# Altium project Pukk-Sensor-Module-v1.0.PrjPcb (part 2 of 6)

## Sheet Power-Sheet.SchDoc
size 420 x 297 mm; SheetNumber: 2; SheetTotal: 8
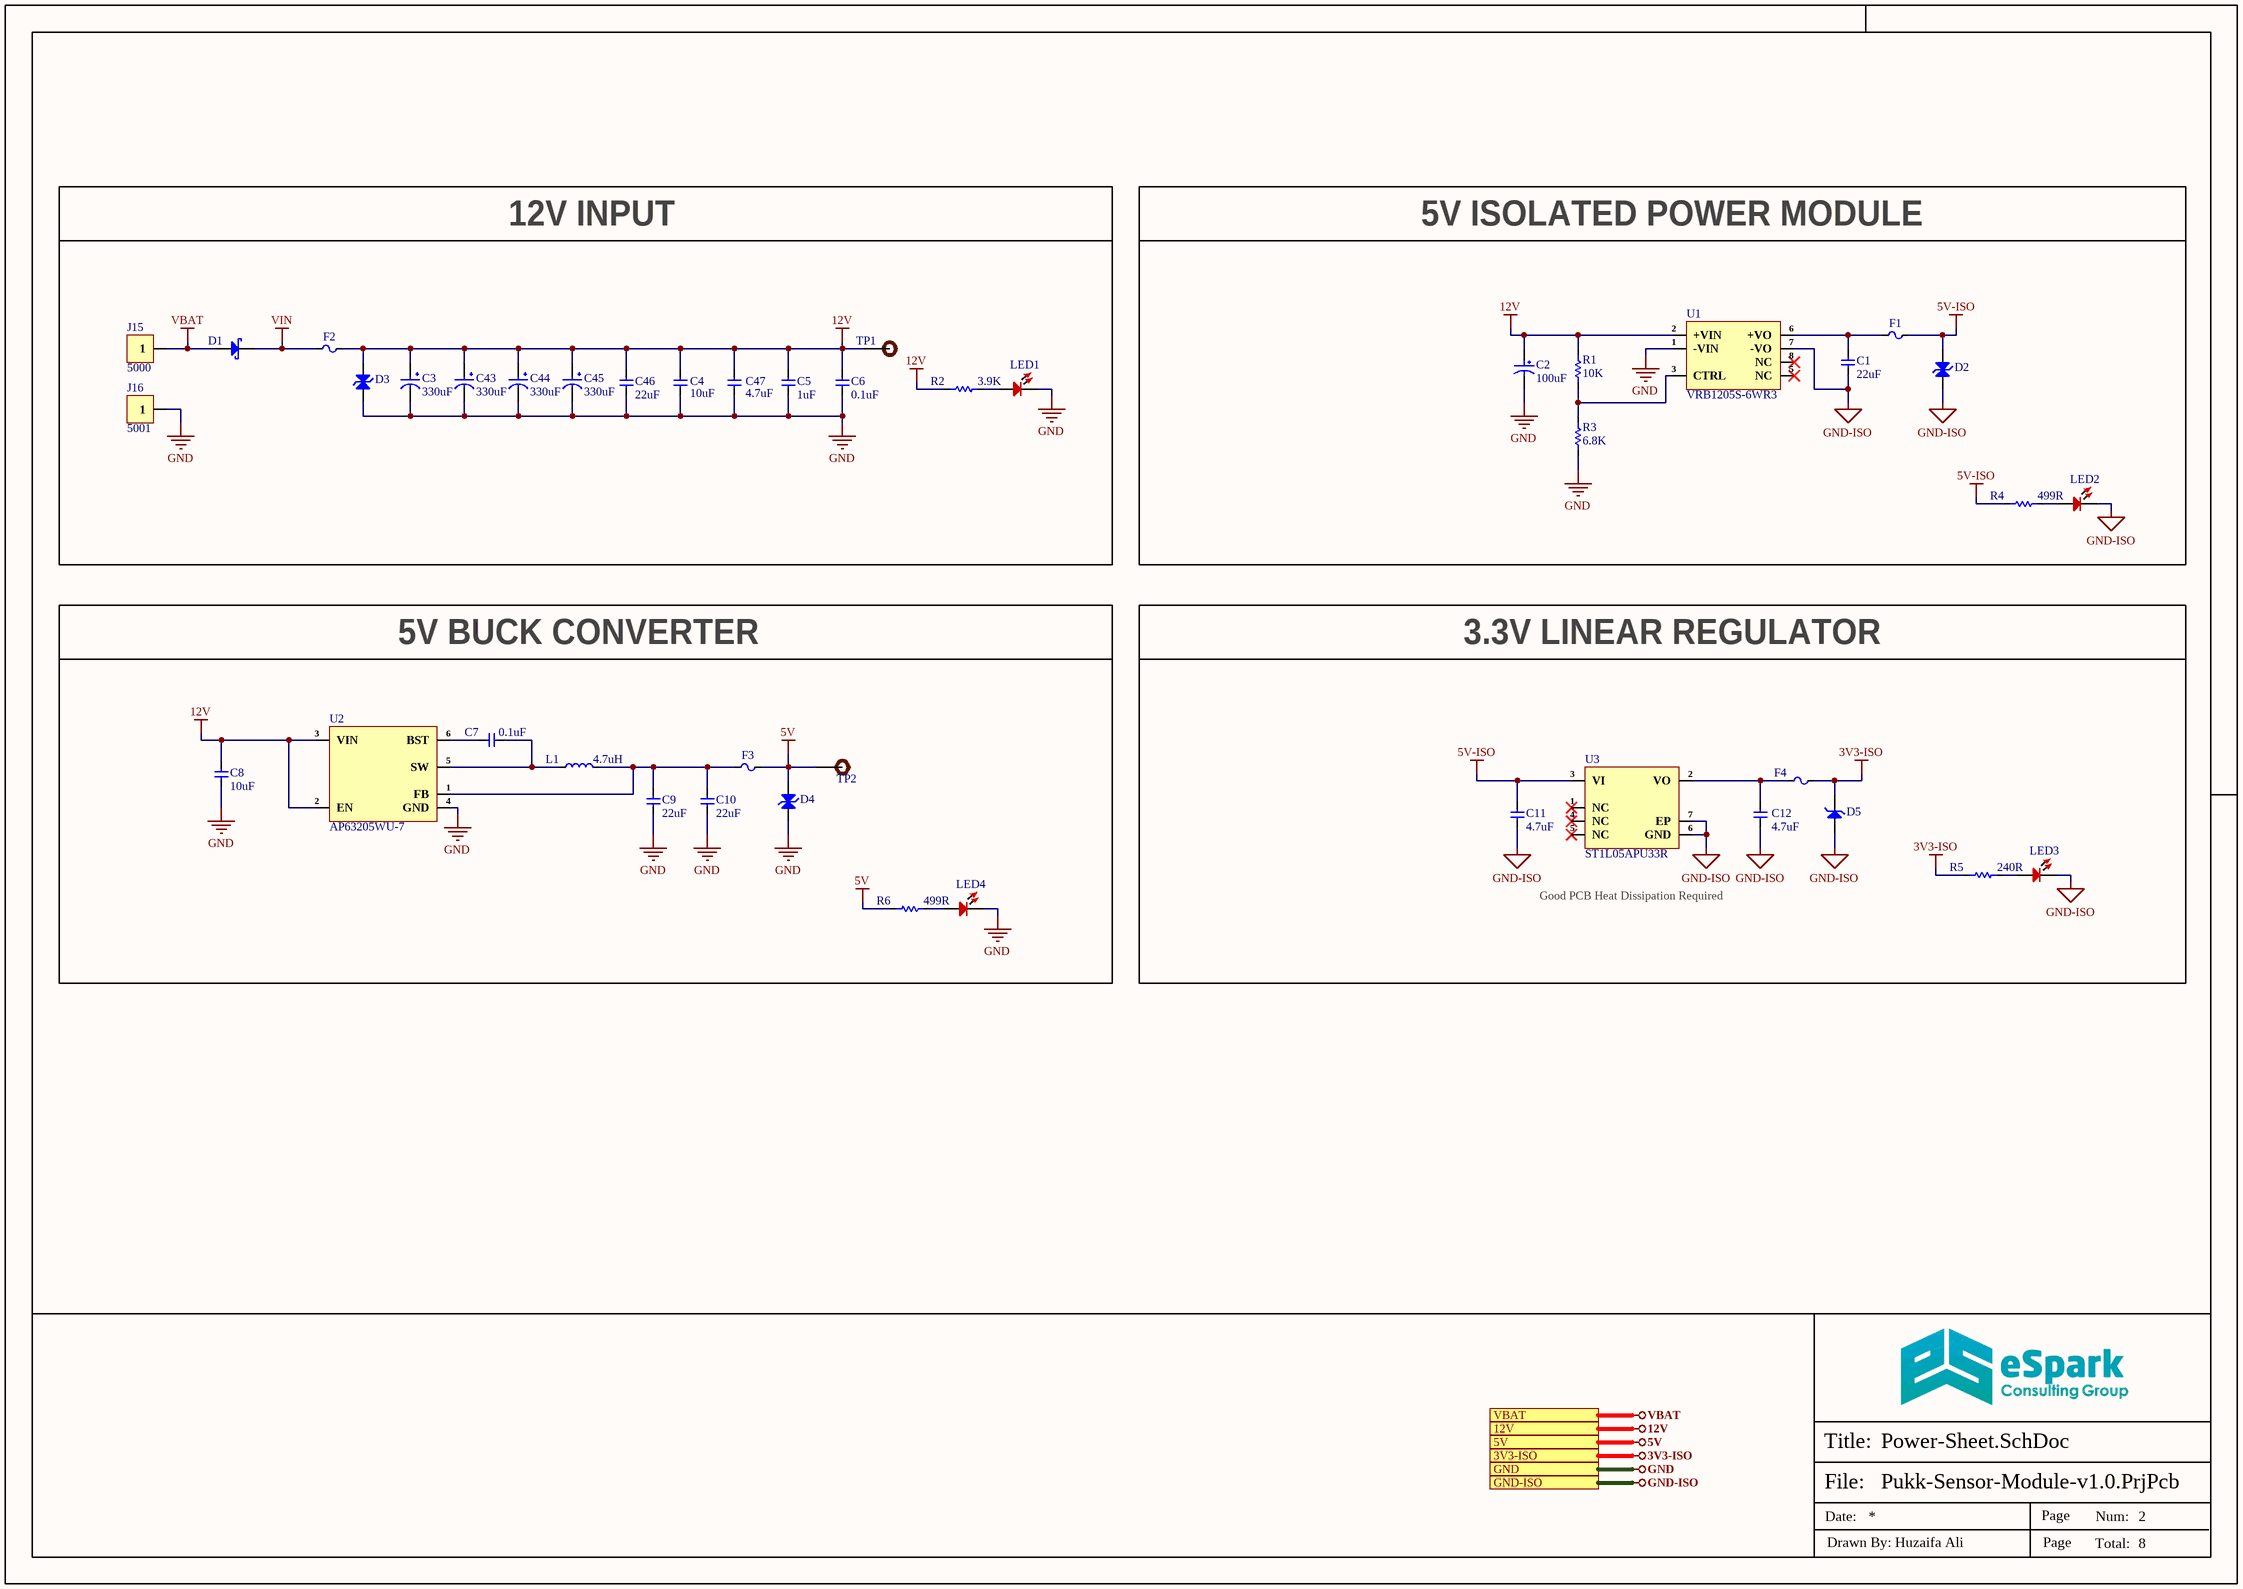
[diagram p1: Power-Sheet.SchDoc]

### Parts
C1  22uF  [Cap-0805]
C2  100uF  [EEE-FK1E101XP]
C3  330uF  [UWT1E331MNL1GS]
C4  10uF  [Cap-0805]
C5  1uF  [Cap-0805]
C6  0.1uF  [Cap-0805]
C7  0.1uF  [Cap-0603]
C8  10uF  [Cap-1210]
C9  22uF  [Cap-0805]
C10  22uF  [Cap-0805]
C11  4.7uF  [Cap-1206]
C12  4.7uF  [Cap-0603]
C43  330uF  [UWT1E331MNL1GS]
C44  330uF  [UWT1E331MNL1GS]
C45  330uF  [UWT1E331MNL1GS]
C46  22uF  [Cap-0805]
C47  4.7uF  [Cap-0805]
D1  SS26  [SMA(DO-214AC)]  (value not drawn)
D2  SMAJ5.0CA  [SMA Bi Directional]  (value not drawn)
D3  SD15C.TCT  [SOD-323 (Bi-directional)]  (value not drawn)
D4  SMAJ5.0CA  [SMA Bi Directional]  (value not drawn)
D5  MSP3V3HM3/89A  [MicroSMP]  (value not drawn)
F1  0805L110SLYR  [Fuse-0805]  (value not drawn)
F2  1210L075/24PR  [FUSE-1210]  (value not drawn)
F3  0805L050WR  [Fuse-0805]  (value not drawn)
F4  0805L110SLYR  [Fuse-0805]  (value not drawn)
J15  5000  [5000]
J16  5001  [5001]
L1  4.7uH  [SRN4018-4R7M]
LED1  RED  [LED-0603]  (value not drawn)
LED2  RED  [LED-0603]  (value not drawn)
LED3  RED  [LED-0603]  (value not drawn)
LED4  RED  [LED-0603]  (value not drawn)
R1  10K  [Res-0402]
R2  3.9K  [Res-0402]
R3  6.8K  [Res-0402]
R4  499R  [Res-0402]
R5  240R  [Res-0402]
R6  499R  [Res-0402]
TP1  TEST POINT  [Test-point]  (value not drawn)  (no BOM)
TP2  TEST POINT  [Test-point]  (value not drawn)  (no BOM)
U1  VRB1205S-6WR3  [VRB1205S-6WR3]
U2  AP63205WU-7  [TSOT-23-6]
U3  ST1L05APU33R  [DFN-6(3x3)]

### Blocks framed on the sheet
12V INPUT: C3-C6 C43-C47 D1 D3 F2 J15 J16 LED1 R2 TP1
5V ISOLATED POWER MODULE: C1 C2 D2 F1 LED2 R1 R3 R4 U1
5V BUCK CONVERTER: C7-C10 D4 F3 L1 LED4 R6 TP2 U2
3.3V LINEAR REGULATOR: C11 C12 D5 F4 LED3 R5 U3

### Ports
3V3-ISO (see Top-Sheet[2A], CAN-Sheet[4D], Controller-Sheet-1[4D], Controller-Sheet-2[4D], Sensors-Sheet[1D]), 5V (see Top-Sheet[2A], Sensors-Sheet[1D]), 12V (see Top-Sheet[2A], Sensors-Sheet[1D]), GND (see Top-Sheet[2A], Connector-Sheet[4D], Sensors-Sheet[1D]), GND-ISO (see Top-Sheet[2A], CAN-Sheet[4D], Controller-Sheet-1[4D], Controller-Sheet-2[4D], Sensors-Sheet[1D], USB-Sheet[4D]), VBAT (see Top-Sheet[2A], Connector-Sheet[4D])

### Nets
3V3-ISO: D5.2(K) F4.2 R5.1 ; port 3V3-ISO
5V: D4.2(K) F3.2 R6.1 TP2.1 ; port 5V
5V-ISO: C11.2 D2.2(K) F1.2 R4.1 U3.3(VI)
12V: C2.1 C3.1 C4.2 C5.2 C6.2 C8.2 C43.1 C44.1 C45.1 C46.2 C47.2 D3.2(A) F2.2 R1.2 R2.1 TP1.1 U1.2(+VIN) U2.2(EN) U2.3(VIN) ; port 12V
GND: C2.2 C3.2 C4.1 C5.1 C6.1 C8.1 C9.1 C10.1 C43.2 C44.2 C45.2 C46.1 C47.1 D3.1(A) D4.1(A) J16.1 LED1.2 LED4.2 R3.1 U1.1(-VIN) U2.4(GND) ; port GND
GND-ISO: C1.1 C11.1 C12.1 D2.1(A) D5.1(A) LED2.2 LED3.2 U1.7(-VO) U3.6(GND) U3.7(EP) ; port GND-ISO
VBAT: D1.2(A) J15.1 ; port VBAT
VIN: D1.1(K) F2.1
NetC1_2: C1.2 F1.1 U1.6(+VO)
NetC7_1: C7.1 L1.1 U2.5(SW)
NetC7_2: C7.2 U2.6(BST)
NetC9_2: C9.2 C10.2 F3.1 L1.2 U2.1(FB)
NetC12_2: C12.2 F4.1 U3.2(VO)
NetLED1_1: LED1.1 R2.2
NetLED2_1: LED2.1 R4.2
NetLED3_1: LED3.1 R5.2
NetLED4_1: LED4.1 R6.2
NetR1_1: R1.1 R3.2 U1.3(CTRL)

Not connected (* = marked no-connect by the designer): U1 5(NC)* 8(NC)*; U3 1(NC)* 4(NC)* 5(NC)*

### Notes on the sheet
- Good PCB Heat Dissipation Required
- File:
- Title:
- Date:
- Page
- Num:
- Total:
- Drawn By: Huzaifa Ali

### Library data of the parts
C1 C9 C10 = GRM21BZ71A226ME15L: CAP CER 22UF 10V X7R 0805; Manufacturer: Murata; Material: 4241ConductorMaterial; Tolerance: 20%; Item Type: Capacitor; Supplier: Digi-Key; Supplier Part Number: 490-GRM21BZ71A226ME15LCT-ND; Manufacturer Part Number: GRM21BZ71A226ME15L; RoHS: Yes; Category: Ceramic Capacitors; Stock: 49126; Pricing: 1=0.39, 10=0.259, 50=0.191, 100=0.1556, 500=0.12282, 1000=0.10372 (USD); Package: 0805; Min Operating Temperature: -55°C; Max Operating Temperature: 125°C; Value: 22uF; Voltage Rating: 10V; Length: 2mm; Width: 1.25mm; Height: 1.45mm; Thickness: 1.25mm; ComponentLink1URL: https://datasheet.octopart.com/GRM21BZ71A226ME15L-Murata-datasheet-165579666.pdf?src-supplier=TME; ComponentLink1Description: https://datasheet.octopart.com/GRM21BZ71A226ME15L-Murata-datasheet-165579666.pdf?src-supplier=TME; LCSC Part Number: C907991; ComponentLink2Description: LCSC; ComponentLink2URL: https://www.lcsc.com/product-detail/Multilayer-Ceramic-Capacitors-MLCC-SMD-SMT_Murata-Electronics-GRM21BZ71A226ME15L_C907991.html
C2 = EEE-FK1E101XP: CAP ALUM 100UF 20% 25V SMD; Manufacturer: Panasonic; Item Type: Capacitor; Ripple Current: 280mA; ESR (Equivalent Series Resistance): 340mR; Life (Hours): 2000Hour; Leakage Current: 3uA; Lead Diameter: 0.65mm; Supplier: Mouser; LCSC Part Number: C128510; Manufacturer Part Number: EEE-FK1E101XP; RoHS: Yes; Stock: 18001; Pricing: 1=0.56, 10=0.293, 50=0.293, 100=0.263, 1000=0.168, 10000=0.147 (USD); Mounting Technology: Surface Mount,PCB; Case/Package: Radial; Pins: 8; Min Operating Temperature: -55°C; Max Operating Temperature: 105°C; Tolerance: 20%; Value: 100uF; Voltage Rating (DC): 25V; Packaging: Tape and Reel; Voltage Rating: 25V; Ripple Current (AC): 280mA; Impedance: 340mR; Package Quantity: 1; Termination: SMD/SMT; Voltage: 25V; Series: FK; Construction: Cylindrical; Diameter: 6.3mm; Length: 7.7mm; Width: 7.8mm; Height: 7.7mm; Lead Pitch: 1.8mm; Height - Seated (Max): 0.303inch; Ratings: AEC-Q200; Radiation Hardening: No; Reach SVHC Compliant: No; RoHS Compliant: Yes; Lead Free: 5697LeadFree; ComponentLink1URL: https://datasheet.ciiva.com/11777/0900766b80e4e8b0-11777232.pdf?src-supplier=Rs; ComponentLink1Description: https://datasheet.ciiva.com/11777/0900766b80e4e8b0-11777232.pdf?src-supplier=Rs; ComponentLink2URL: https://datasheet.ciiva.com/2983/aba0000ce120-2983949.pdf?src-supplier=Avnet; ComponentLink2Description: https://datasheet.ciiva.com/2983/aba0000ce120-2983949.pdf?src-supplier=Avnet; ComponentLink3URL: https://datasheet.ciiva.com/46386/1676921-46386184.pdf?src-supplier=Element14; ComponentLink3Description: https://datasheet.ciiva.com/46386/1676921-46386184.pdf?src-supplier=Element14; ComponentLink4URL: https://datasheet.ciiva.com/46376/1676921-46376486.pdf?src-supplier=Element14; ComponentLink4Description: https://datasheet.ciiva.com/46376/1676921-46376486.pdf?src-supplier=Element14; ComponentLink5URL: https://datasheet.ciiva.com/43463/58258-43463513.pdf?src-supplier=Farnell; ComponentLink5Description: https://datasheet.ciiva.com/43463/58258-43463513.pdf?src-supplier=Farnell; ComponentLink6URL: https://datasheet.ciiva.com/46386/58258-46386183.pdf?src-supplier=Element14; ComponentLink6Description: https://datasheet.ciiva.com/46386/58258-46386183.pdf?src-supplier=Element14; ComponentLink7URL: https://datasheet.ciiva.com/28678/731857-28678871.pdf?src-supplier=Element14; ComponentLink7Description: https://datasheet.ciiva.com/28678/731857-28678871.pdf?src-supplier=Element14; ComponentLink8URL: https://datasheet.ciiva.com/24023/aba0000ce120-24023434.pdf?src-supplier=Mouser; ComponentLink8Description: https://datasheet.ciiva.com/24023/aba0000ce120-24023434.pdf?src-supplier=Mouser; ComponentLink9URL: https://datasheet.ciiva.com/14594/70258115-14594399.pdf?src-supplier=Allied+Electronics; ComponentLink9Description: https://datasheet.ciiva.com/14594/70258115-14594399.pdf?src-supplier=Allied+Electronics; ComponentLink10URL: https://datasheet.ciiva.com/2983/aba0000ce120-2983950.pdf?src-supplier=Avnet; ComponentLink10Description: https://datasheet.ciiva.com/2983/aba0000ce120-2983950.pdf?src-supplier=Avnet; ComponentLink11URL: https://datasheet.ciiva.com/16449/aba0000ce120-16449109.pdf?src-supplier=Future+Electronics; ComponentLink11Description: https://datasheet.ciiva.com/16449/aba0000ce120-16449109.pdf?src-supplier=Future+Electronics
C3 C43-C45 = UWT1E331MNL1GS: CAP ALUM 330UF 20% 25V SMD; Manufacturer: Nichicon; Polarity: 5066Direction; Item Type: Capacitor; Dielectric Material: 158ConductorMaterial; Manufacturer Part Number: UWT1E331MNL1GS; RoHS: Yes; Lead Free: 5697LeadFree; ComponentLink1URL: https://datasheet.ciiva.com/30522/getdatasheetpartid-457641-30522227.pdf?src-supplier=Verical; ComponentLink1Description: https://datasheet.ciiva.com/30522/getdatasheetpartid-457641-30522227.pdf?src-supplier=Verical; ComponentLink2URL: https://datasheet.ciiva.com/97/e-wt-97107.pdf?src-supplier=Digikey; ComponentLink2Description: https://datasheet.ciiva.com/97/e-wt-97107.pdf?src-supplier=Digikey; ComponentLink3URL: https://datasheet.ciiva.com/97/e-wt-97108.pdf?src-supplier=Digikey; ComponentLink3Description: https://datasheet.ciiva.com/97/e-wt-97108.pdf?src-supplier=Digikey; ComponentLink4URL: https://datasheet.ciiva.com/97/e-wt-97109.pdf?src-supplier=Digikey; ComponentLink4Description: https://datasheet.ciiva.com/97/e-wt-97109.pdf?src-supplier=Digikey; LCSC Part Number: C445067; Supplier: Digikey; Stock: 31265; Pricing: 1=0.53, 10=0.353, 50=0.2762, 100=0.2506 (USD); Pins: 2NUMBER; ComponentLink5URL: https://datasheet.ciiva.com/11782/0900766b80649b51-11782007.pdf?src-supplier=Rs; ComponentLink5Description: https://datasheet.ciiva.com/11782/0900766b80649b51-11782007.pdf?src-supplier=Rs; ComponentLink6URL: https://datasheet.ciiva.com/11686/e-wt-11686502.pdf?src-supplier=Avnet; ComponentLink6Description: https://datasheet.ciiva.com/11686/e-wt-11686502.pdf?src-supplier=Avnet; ComponentLink7URL: https://datasheet.ciiva.com/7851/e-wt-7851757.pdf?src-supplier=Element14; ComponentLink7Description: https://datasheet.ciiva.com/7851/e-wt-7851757.pdf?src-supplier=Element14; ComponentLink8URL: https://datasheet.ciiva.com/16502/e-wt-16502936.pdf?src-supplier=Future+Electronics; ComponentLink8Description: https://datasheet.ciiva.com/16502/e-wt-16502936.pdf?src-supplier=Future+Electronics
C4 = CC0805KKX5R8BB106: CAP CER 10UF 25V X5R 0805; Manufacturer: Yageo; Item Type: Capacitor; Tolerance: 10%; LCSC Part Number: C89831; Manufacturer Part Number: CC0805KKX5R8BB106; RoHS: Yes; Case/Package: 0805; Case Code (Metric): 2012; Case Code (Imperial): 0805; Weight: 0.000194oz; Min Operating Temperature: -55°C; Max Operating Temperature: 85°C; Voltage Rating: 25V; Packaging: Tape and Reel; Dielectric: X5R; Termination: SMD/SMT; Voltage Rating (DC): 25V; Series: CC; Length: 0.079inch; Width: 0.049inch; Thickness: 0.057inch; Depth: 1.25mm; RoHS Compliant: Yes; Lead Free: Lead Free; ComponentLink1URL: http://www.mouser.com/ds/2/447/UPY-GPHC_X5R_4V-to-50V_25-1131599.pdf?src-supplier=Mouser; ComponentLink1Description: http://www.mouser.com/ds/2/447/UPY-GPHC_X5R_4V-to-50V_25-1131599.pdf?src-supplier=Mouser; ComponentLink2URL: http://www.yageo.com/documents/recent/UPY-GPHC_X5R_4V-to-50V_25.pdf?src-supplier=Digi-Key; ComponentLink2Description: http://www.yageo.com/documents/recent/UPY-GPHC_X5R_4V-to-50V_25.pdf?src-supplier=Digi-Key; Supplier 1: Digi-Key; Category: Ceramic Capacitors; Stock 1: 554290; Pricing 1: 1=0.31000, 10=0.21200, 50=0.14820, 100=0.12710, 500=0.09534, 1000=0.08050 (USD); Mount: Surface Mount; Capacitance: 10uF; Resistor Type: Ceramic; Halogen Free: Halogen Free; Supplier Part Number 1: 311-1869-1-ND
C5 = 08055C105KAT2A: CAP CER 1UF 50V X7R 0805; Manufacturer: Kyocera AVX; Item Type: Capacitors; Material: Ceramic; Tolerance: 10%; Supplier: Rs; LCSC Part Number: C2167382; Manufacturer Part Number: 08055C105KAT2A; RoHS: Yes; Stock: 6530; Mounting Technology: Surface Mount; Case/Package: 0805; Case Code (Metric): 2012; Case Code (Imperial): 0805; Min Operating Temperature: -55°C; Max Operating Temperature: 125°C; Value: 1uF; Dielectric: X7R; Packaging: Tape and Reel; Voltage Rating: 50V; Termination: SMD/SMT; Package Quantity: 1; Series: -; Length: 2.01mm; Width: 0.049inch; Thickness: 0.037inch; Lead Free: Lead Free; RoHS Compliant: Yes; ComponentLink1URL: https://datasheet.ciiva.com/25613/0900766b810a29b7-25613127.pdf?src-supplier=Rs; ComponentLink1Description: https://datasheet.ciiva.com/25613/0900766b810a29b7-25613127.pdf?src-supplier=Rs; ComponentLink2URL: https://datasheet.ciiva.com/6268/cx7r-6268826.pdf?src-supplier=Digikey; ComponentLink2Description: https://datasheet.ciiva.com/6268/cx7r-6268826.pdf?src-supplier=Digikey; ComponentLink3URL: https://datasheet.ciiva.com/7812/cx7r-7812085.pdf?src-supplier=Element14; ComponentLink3Description: https://datasheet.ciiva.com/7812/cx7r-7812085.pdf?src-supplier=Element14; Pricing: 10=1.518, 50=1.406, 100=1.309, 250=1.137, 500=0.98 (DKK); Voltage: 50V; Depth: 1.25mm; Reach SVHC Compliant: No; ComponentLink4URL: https://datasheet.ciiva.com/22706/1679506-22706999.pdf?src-supplier=Element14; ComponentLink4Description: https://datasheet.ciiva.com/22706/1679506-22706999.pdf?src-supplier=Element14; ComponentLink5URL: https://datasheet.ciiva.com/46385/1818074-46385893.pdf?src-supplier=Element14; ComponentLink5Description: https://datasheet.ciiva.com/46385/1818074-46385893.pdf?src-supplier=Element14; ComponentLink6URL: https://datasheet.ciiva.com/14887/cx7r-14887080.pdf?src-supplier=Digikey; ComponentLink6Description: https://datasheet.ciiva.com/14887/cx7r-14887080.pdf?src-supplier=Digikey; ComponentLink7URL: https://datasheet.ciiva.com/14887/cx7r-14887081.pdf?src-supplier=Digikey; ComponentLink7Description: https://datasheet.ciiva.com/14887/cx7r-14887081.pdf?src-supplier=Digikey
C6 = CL21F104ZBCNNNC: CAP CER 0.1UF 50V Y5V 0805; Manufacturer: Samsung; Tolerance: 80%; Capacitance: 100nF; Material: Ceramic; Supplier 1: Digi-Key; Manufacturer Part Number: CL21F104ZBCNNNC; Stock 1: 4901061; Pricing 1: 1=0.1, 10=0.044, 100=0.0195, 500=0.0139, 1000=0.01092 (USD); Mount: Surface Mount; Case/Package: 0805; Case Code (Imperial): 0805; Case Code (Metric): 2012; Min Operating Temperature: -30°C; Max Operating Temperature: 85°C; Dielectric: Y5V; Voltage Rating: 50V; Packaging: Tape and Reel; Length: 2mm; Width: 0.049inch; Height: 0.85mm; Thickness: 0.037inch; Depth: 1.25mm; Radiation Hardening: No; ComponentLink1URL: https://media.digikey.com/pdf/Data%20Sheets/Samsung%20PDFs/CL_Series_MLCC_ds.pdf?src-supplier=Digi-Key; ComponentLink1Description: https://media.digikey.com/pdf/Data%20Sheets/Samsung%20PDFs/CL_Series_MLCC_ds.pdf?src-supplier=Digi-Key; Supplier Part Number 1: 1276-1007-6-ND; LCSC Part Number: C1760; Package Quantity: 1
C7 = CL10B104KB8WPNC: CAP CER 0.1UF 50V X7R 0603; Item Type: Capacitor; Material: 4241ConductorMaterial; Value: 100nF; Tolerance: 10%; LCSC Part Number: C307348; ComponentLink1Description: LCSC; Supplier: Rs; Supplier Part Number: 2575919; RoHS: Yes; Category: Ceramic Capacitors; Stock: 400; Pricing: 100=0.021, 500=0.019, 1000=0.015, 2000=0.01 (GBP); Mounting Technology: Surface Mount; Case/Package: 0603; Case Code (Metric): 1608; Case Code (Imperial): 0603; Min Operating Temperature: -55°C; Max Operating Temperature: 125°C; Packaging: Cut Tape; Voltage Rating: 50V; Series: CL; Voltage Rating (DC): 50V; Height: 900um; Ratings: AEC-Q200; RoHS Compliant: Yes; Lead Free: 5697LeadFree; ComponentLink2URL: http://www.farnell.com/datasheets/2710560.pdf?src-supplier=Farnell; ComponentLink2Description: http://www.farnell.com/datasheets/2710560.pdf?src-supplier=Farnell; ComponentLink3URL: http://www.samsungsem.com/kr/support/product-search/mlcc/CL10B104KB8WPNC.jsp?src-supplier=Digi-Key; ComponentLink3Description: http://www.samsungsem.com/kr/support/product-search/mlcc/CL10B104KB8WPNC.jsp?src-supplier=Digi-Key; ComponentLink4URL: http://www.farnell.com/datasheets/2710560.pdf?src-supplier=Element14; ComponentLink4Description: http://www.farnell.com/datasheets/2710560.pdf?src-supplier=Element14; ComponentLink5URL: https://datasheet.octopart.com/CL10B104KB8WPNC-Samsung-Electro-Mechanics-datasheet-120093645.pdf?src-supplier=Future+Electronics; ComponentLink5Description: https://datasheet.octopart.com/CL10B104KB8WPNC-Samsung-Electro-Mechanics-datasheet-120093645.pdf?src-supplier=Future+Electronics; ComponentLink6URL: http://www.farnell.com/datasheets/2710560.pdf?src-supplier=Newark; ComponentLink6Description: http://www.farnell.com/datasheets/2710560.pdf?src-supplier=Newark; ComponentLink7URL: http://www.samsungsem.com/servlet/FileDownload?type=spec&file=CL10B104KB8WPNC.pdf&src-supplier=Avnet; ComponentLink7Description: http://www.samsungsem.com/servlet/FileDownload?type=spec&file=CL10B104KB8WPNC.pdf&src-supplier=Avnet; ComponentLink8URL: https://datasheet.octopart.com/CL10B104KB8WPNC-Samsung-datasheet-8326407.pdf?src-supplier=TME; ComponentLink8Description: https://datasheet.octopart.com/CL10B104KB8WPNC-Samsung-datasheet-8326407.pdf?src-supplier=TME
C8 = CC1210KKX7R9BB106: CAP CER 10UF 50V X7R 1210; Manufacturer: Yageo; Item Type: Capacitors; Tolerance: 10%; Supplier: Farnell; LCSC Part Number: C596319; Manufacturer Part Number: CC1210KKX7R9BB106; RoHS: Yes; Stock: 76; Mounting Technology: Surface Mount; Case/Package: 1210; Case Code (Metric): 3225; Case Code (Imperial): 1210; Min Operating Temperature: -55°C; Max Operating Temperature: 125°C; Value: 10uF; Dielectric: X7R; Packaging: Cut Tape; Voltage Rating: 50V; Voltage Rating (DC): 50V; Series: CC; Length: 0.126inch; Width: 0.098inch; Thickness: 0.11inch; Lead Free: Lead Free; Halogen Free: Halogen Free; RoHS Compliant: Yes; ComponentLink1URL: https://datasheet.octopart.com/CC1210KKX7R9BB106-Yageo-datasheet-147453679.pdf?src-supplier=Newark; ComponentLink1Description: https://datasheet.octopart.com/CC1210KKX7R9BB106-Yageo-datasheet-147453679.pdf?src-supplier=Newark; ComponentLink2URL: https://datasheet.octopart.com/CC1210KKX7R9BB106-Yageo-datasheet-166511530.pdf?src-supplier=Future+Electronics; ComponentLink2Description: https://datasheet.octopart.com/CC1210KKX7R9BB106-Yageo-datasheet-166511530.pdf?src-supplier=Future+Electronics; ComponentLink3URL: http://www.yageo.com/documents/recent/UPY-GPHC_X7R_6.3V-to-50V_18.pdf?src-supplier=Digikey; ComponentLink3Description: http://www.yageo.com/documents/recent/UPY-GPHC_X7R_6.3V-to-50V_18.pdf?src-supplier=Digikey; ComponentLink4URL: http://www.yageo.com/exep/pages/download/literatures/ProductSelectionGuide%202014_Final_2.pdf?src-supplier=Digikey; ComponentLink4Description: http://www.yageo.com/exep/pages/download/literatures/ProductSelectionGuide%202014_Final_2.pdf?src-supplier=Digikey; ComponentLink5URL: https://datasheet.octopart.com/CC1210KKX7R9BB106-Yageo-datasheet-151948686.pdf?src-supplier=Farnell; ComponentLink5Description: https://datasheet.octopart.com/CC1210KKX7R9BB106-Yageo-datasheet-151948686.pdf?src-supplier=Farnell
C11 = UMK316AB7475KL-T: CAP CER 4.7UF 50V X7R 1206; Manufacturer: Taiyo Yuden; Item Type: Capacitor; Tolerance: 10%; Supplier: Digikey; LCSC Part Number: C92853; Manufacturer Part Number: UMK316AB7475KL-T; RoHS: Yes; Stock: 392550; Pricing: 1=0.3, 10=0.198, 50=0.146, 100=0.1189, 500=0.09386, 1000=0.07925 (USD); Mounting Technology: Surface Mount; Case/Package: 1206; Pins: 2; Case Code (Metric): 3216; Case Code (Imperial): 1206; Min Operating Temperature: -55°C; Max Operating Temperature: 125°C; Value: 4.7uF; Voltage Rating: 50V; Packaging: Tape and Reel; Package Quantity: 2000; Voltage Rating (DC): 50V; Dielectric: X7R; Termination: SMD/SMT; Series: M; Construction: Flat; Length: 3.2mm; Width: 1.6mm; Height: 1.6mm; Depth: 1.6mm; Radiation Hardening: No; RoHS Compliant: Yes; Reach SVHC Compliant: Unknown; ComponentLink1URL: https://datasheet.ciiva.com/170/umk316ab7475kl-t-ss-170928.pdf?src-supplier=Digikey; ComponentLink1Description: https://datasheet.ciiva.com/170/umk316ab7475kl-t-ss-170928.pdf?src-supplier=Digikey; ComponentLink2URL: https://datasheet.ciiva.com/2990/umk316ab7475kl-t-ss-2990070.pdf?src-supplier=Avnet; ComponentLink2Description: https://datasheet.ciiva.com/2990/umk316ab7475kl-t-ss-2990070.pdf?src-supplier=Avnet; ComponentLink3URL: https://datasheet.ciiva.com/15922/1010umk316ab7475kl-t-15922628.pdf?src-supplier=Onlinecomponents.com; ComponentLink3Description: https://datasheet.ciiva.com/15922/1010umk316ab7475kl-t-15922628.pdf?src-supplier=Onlinecomponents.com; ComponentLink4URL: https://datasheet.ciiva.com/7975/1481447-7975911.pdf?src-supplier=Element14; ComponentLink4Description: https://datasheet.ciiva.com/7975/1481447-7975911.pdf?src-supplier=Element14; ComponentLink5URL: https://datasheet.ciiva.com/5413/mlcc-all-e-541559-5413006.pdf?src-supplier=Mouser; ComponentLink5Description: https://datasheet.ciiva.com/5413/mlcc-all-e-541559-5413006.pdf?src-supplier=Mouser
C12 = GRM188R61E475KE11D: CAP CER 4.7UF 25V X5R 0603; Manufacturer: Murata; Tolerance: 10%; Material: Ceramic; LCSC Part Number: C90057; Manufacturer Part Number: GRM188R61E475KE11D; Case/Package: 0603; Case Code (Metric): 1608; Case Code (Imperial): 0603; Min Operating Temperature: -55°C; Max Operating Temperature: 85°C; Voltage Rating: 25V; Packaging: Cut Tape; Package Quantity: 4000; Voltage Rating (DC): 25V; Dielectric: X5R; Length: 1.6mm; Width: 0.031inch; Height: 0.8mm; Depth: 0.8mm; ComponentLink1URL: http://www.farnell.com/datasheets/2048165.pdf?src-supplier=Element14; ComponentLink1Description: http://www.farnell.com/datasheets/2048165.pdf?src-supplier=Element14; ComponentLink2URL: https://www.murata.com/~/media/webrenewal/support/library/catalog/products/capacitor/mlcc/c02e.ashx?la=en-us&src-supplier=Digi-Key; ComponentLink2Description: https://www.murata.com/~/media/webrenewal/support/library/catalog/products/capacitor/mlcc/c02e.ashx?la=en-us&src-supplier=Digi-Key; Supplier 1: Digi-Key; Stock 1: 71618; Pricing 1: 1=0.37, 10=0.258, 100=0.1549, 500=0.1162, 1000=0.09812 (USD); Mount: Surface Mount; Capacitance: 4.7uF; Voltage: 25V; Thickness: 0.031inch; REACH SVHC: No SVHC; Lead Free: Lead Free; Supplier Part Number 1: 490-7203-1-ND
C46 = GRM21BR61E226ME44L: CAP CER 22UF 25V X5R 0805; Manufacturer: Murata; Material: Ceramic; Tolerance: 20%; Item Type: Capacitor; Supplier 1: Arrow Electronics; Manufacturer Part Number: GRM21BR61E226ME44L; RoHS: Yes; Category: Ceramic Capacitors; Stock 1: 21193; Pricing 1: 1=0.45930, 10=0.35000, 25=0.33950, 50=0.26910, 100=0.22090, 250=0.21320, 500=0.16760, 1000=0.14640, 3000=0.11710, 6000=0.10550, 15000=0.10450 (USD); Mount: Surface Mount; Case/Package: 0805; Case Code (Metric): 2012; Case Code (Imperial): 0805; Weight: 0.000335oz; Min Operating Temperature: -55°C; Max Operating Temperature: 85°C; Capacitance: 22uF; Voltage Rating: 25V; Packaging: Tape and Reel; Dielectric: X5R; Voltage: 25V; Termination: SMD/SMT; Resistor Type: Ceramic; Voltage Rating (DC): 25V; Package Quantity: 3000; Series: GRM; Construction: Flat; Length: 2mm; Width: 1.25mm; Height: 1.25mm; Thickness: 0.057inch; Depth: 1.25mm; REACH SVHC: No SVHC; Lead Free: Lead Free; RoHS Compliant: Yes; ComponentLink1URL: https://datasheet.ciiva.com/22787/1747471-22787265.pdf?src-supplier=Farnell; ComponentLink1Description: https://datasheet.ciiva.com/22787/1747471-22787265.pdf?src-supplier=Farnell; ComponentLink2URL: https://datasheet.ciiva.com/7719/1747471-7719095.pdf?src-supplier=Element14; ComponentLink2Description: https://datasheet.ciiva.com/7719/1747471-7719095.pdf?src-supplier=Element14; ComponentLink3URL: https://datasheet.ciiva.com/28584/1747471-28584199.pdf?src-supplier=Element14; ComponentLink3Description: https://datasheet.ciiva.com/28584/1747471-28584199.pdf?src-supplier=Element14; Supplier Part Number 1: GRM21BR61E226ME44L; LCSC Part Number: C86816
C47 = CC0805KKX7R8BB475: CAP CER 4.7UF 25V X7R 0805; Manufacturer: Yageo; Material: 4241ConductorMaterial; Tolerance: 10%; Item Type: Capacitors; Manufacturer Part Number: CC0805KKX7R8BB475; Case/Package: 0805; Case Code (Metric): 2012; Case Code (Imperial): 0805; Min Operating Temperature: -55°C; Max Operating Temperature: 125°C; Package Quantity: 3000; Packaging: Tape and Reel; Voltage Rating: 25V; Dielectric: X7R; Voltage Rating (DC): 25V; Height: 950um; Lead Free: 5697LeadFree; ComponentLink1URL: http://www.mouser.com/ds/2/447/Yageo_UPY-GP_NP0_16V-to-50V_9-358835.pdf?src-supplier=Mouser; ComponentLink1Description: http://www.mouser.com/ds/2/447/Yageo_UPY-GP_NP0_16V-to-50V_9-358835.pdf?src-supplier=Mouser; ComponentLink2URL: http://www.yageo.com/documents/recent/UPY-GPHC_X7R_6.3V-to-50V_18.pdf?src-supplier=Digikey; ComponentLink2Description: http://www.yageo.com/documents/recent/UPY-GPHC_X7R_6.3V-to-50V_18.pdf?src-supplier=Digikey; LCSC Part Number: C354262; Supplier: Rs; RoHS: Yes; Stock: 150; Pricing: 25=1.316, 250=1.053, 500=0.856, 1000=0.724, 2500=0.658 (DKK); Mounting Technology: Surface Mount; Weight: 0.000194oz; Value: 4.7uF; Termination: SMD/SMT; Series: CC; RoHS Compliant: Yes; Halogen Free: 5694HalogenFree; ComponentLink3URL: https://www.yageo.com/upload/media/product/productsearch/datasheet/mlcc/UPY-GPHC_X7R_6.3V-to-50V_18.pdf?src-supplier=Digikey; ComponentLink3Description: https://www.yageo.com/upload/media/product/productsearch/datasheet/mlcc/UPY-GPHC_X7R_6.3V-to-50V_18.pdf?src-supplier=Digikey; ComponentLink4URL: https://datasheet.octopart.com/CC0805KKX7R8BB475-Yageo-datasheet-166511530.pdf?src-supplier=Future+Electronics; ComponentLink4Description: https://datasheet.octopart.com/CC0805KKX7R8BB475-Yageo-datasheet-166511530.pdf?src-supplier=Future+Electronics; ComponentLink5URL: https://datasheet.octopart.com/CC0805KKX7R8BB475-Yageo-datasheet-140260305.pdf?src-supplier=Newark; ComponentLink5Description: https://datasheet.octopart.com/CC0805KKX7R8BB475-Yageo-datasheet-140260305.pdf?src-supplier=Newark; ComponentLink6URL: https://datasheet.octopart.com/CC0805KKX7R8BB475-Yageo-datasheet-137700082.pdf?src-supplier=Future+Electronics; ComponentLink6Description: https://datasheet.octopart.com/CC0805KKX7R8BB475-Yageo-datasheet-137700082.pdf?src-supplier=Future+Electronics
D1 = SS26: 60V 700mV@2A 2A SMA(DO-214AC) Schottky Barrier Diodes (SBD) ROHS; Manufacturer: MDD; Item Type: Diode; Manufacturer Part Number: SS26; Package: SMA(DO-214AC); LCSC Part Number: C14238; ComponentLink1Description: LCSC; ComponentLink1URL: https://www.lcsc.com/product-detail/Schottky-Barrier-Diodes-SBD_MDD-Microdiode-Electronics-SS26_C14238.html
D2 D4 = SMAJ5.0CA: TVS DIODE 5VWM 9.2VC SMA; Manufacturer: FTR; Manufacturer Part Number: SMAJ5.0CA; Package: SMA(DO-214AC); Item Type: Diode; LCSC Part Number: C693487; ComponentLink1Description: LCSC; ComponentLink1URL: https://www.lcsc.com/product-detail/TVS_GOODWORK-SMAJ5-0CA_C908809.html
D3 = SD15C.TCT: 29V 350W 16.7V 15V SOD-323 ESD and Surge Protection (TVS/ESD) ROHS; Manufacturer: SEMTECH; Manufacturer Part Number: SD15C.TCT; Package: SOD-323; LCSC Part Number: C780130; Item Type: (TVS/ESD); ComponentLink1Description: LCSC; ComponentLink1URL: https://www.lcsc.com/product-detail/ESD-and-Surge-Protection-TVS-ESD_SEMTECH-SD15C-TCT_C780130.html?s_z=n_SD15C.TCT
D5 = MSP3V3HM3/89A: TVS DIODE 3.3VWM 11.5VC MICROSMP; Manufacturer: Vishay Semiconductors; Direction: Unidirectional; Operating Supply Voltage: 3.3V; Max Surge Current: 75A; Breakdown Voltage: 4.1V; Clamping Voltage: 11V; Peak Pulse Power: 150W; Number of Unidirectional Channels: 1; Power Line Protection: No; Peak Pulse Current: 87A; Test Current: 1mA; Max Reverse Leakage Current: 200uA; Diode Type: ZENER; LCSC Part Number: C241899; Item Type: TVS Diode; ComponentLink2URL: https://datasheet.ciiva.com/14080/msp3v3-14080471.pdf?src-supplier=Digi-Key; ComponentLink2Description: https://datasheet.ciiva.com/14080/msp3v3-14080471.pdf?src-supplier=Digi-Key; Supplier: Mouser; Supplier Part Number: 625-MSP3V3HM3; Manufacturer Part Number: MSP3V3HM3/89A; RoHS: Yes; Category: TVS Diodes; Stock: 14861; Pricing: 1=0.39, 10=0.313, 50=0.313, 100=0.165, 1000=0.068, 10000=0.05 (USD); Mounting Technology: Surface Mount; Min Operating Temperature: -55°C; Max Operating Temperature: 150°C; Packaging: Tape and Reel; Package Quantity: 4500; Polarity: Unidirectional; Reverse Standoff Voltage: 3.3V; Min Breakdown Voltage: 4.1V; Series: Automotive, AEC-Q101, TransZorb®, eSMP™; RoHS Compliant: Yes; ComponentLink1URL: https://datasheet.ciiva.com/14080/msp3v3-14080471.pdf?src-supplier=Digikey; ComponentLink1Description: https://datasheet.ciiva.com/14080/msp3v3-14080471.pdf?src-supplier=Digikey
F1 F4 = 0805L110SLYR: PTC RESET FUSE 6V 1.1A 0805; Manufacturer: Littelfuse; Item Type: Fuses; Supplier: Digikey; LCSC Part Number: C207024; Manufacturer Part Number: 0805L110SLYR; RoHS: Yes; Stock: 3032; Pricing: 1=1.74, 5=1.448, 10=1.339, 50=1.1156, 100=1.0309, 250=0.92832, 500=0.85714, 1000=0.79108 (USD); ComponentLink1URL: https://datasheet.ciiva.com/326/littelfuse-resettable-ptcs-lorho-datasheet-326160.pdf?src-supplier=Digikey; ComponentLink1Description: https://datasheet.ciiva.com/326/littelfuse-resettable-ptcs-lorho-datasheet-326160.pdf?src-supplier=Digikey; ComponentLink2URL: https://datasheet.ciiva.com/28410/949281-28410775.pdf?src-supplier=Element14; ComponentLink2Description: https://datasheet.ciiva.com/28410/949281-28410775.pdf?src-supplier=Element14
F2 = 1210L075/24PR: 24V 750mA 100A 1.5A 1210 Resettable Fuses ROHS; Manufacturer: Littlefuse; Item Type: Fuse; Manufacturer Part Number: 1210L075/24PR; Supplier: Digikey; Supplier Part Number: F4146CT-ND; RoHS: Yes; Category: PTC Resettable Fuses; Stock: 2300; Pricing: 1=0.98, 5=0.81, 10=0.747, 50=0.6196, 100=0.5716, 250=0.51376, 500=0.47378, 1000=0.43676 (USD); Current Rating: 100A; Voltage Rating: 24V; Height: 1.8mm; Lead Free: 5697LeadFree; ComponentLink1URL: https://datasheet.ciiva.com/8005/littelfuse-ptc-1210l-8005372.pdf?src-supplier=Element14; ComponentLink1Description: https://datasheet.ciiva.com/8005/littelfuse-ptc-1210l-8005372.pdf?src-supplier=Element14; ComponentLink2URL: https://datasheet.ciiva.com/326/littelfuse-ptc-1210l-326060.pdf?src-supplier=Digikey; ComponentLink2Description: https://datasheet.ciiva.com/326/littelfuse-ptc-1210l-326060.pdf?src-supplier=Digikey; ComponentLink3URL: https://datasheet.ciiva.com/326/littelfuse-ptc-1210l-326061.pdf?src-supplier=Digikey; ComponentLink3Description: https://datasheet.ciiva.com/326/littelfuse-ptc-1210l-326061.pdf?src-supplier=Digikey; ComponentLink4URL: https://datasheet.ciiva.com/326/littelfuse-ptc-1210l-326062.pdf?src-supplier=Digikey; ComponentLink4Description: https://datasheet.ciiva.com/326/littelfuse-ptc-1210l-326062.pdf?src-supplier=Digikey; LCSC Part Number: C207045
F3 = 0805L050WR: 6V 500mA 100A 1A 0805 Resettable Fuses ROHS; Manufacturer: Littelfuse; Item Type: Fuse; Supplier: DigiKey; Supplier Part Number: F2772CT-ND; Manufacturer Part Number: 0805L050WR; RoHS: Yes; Category: PTC Resettable Fuses; Stock: 52328; Pricing: 1=0.5, 5=0.41, 10=0.378, 50=0.314, 100=0.2897, 250=0.2604, 500=0.2402, 1000=0.2215 (USD); Voltage Rating: 6V; Width: 1.2mm; Height: 1.25mm; Lead Free: 5697LeadFree; ComponentLink1URL: https://datasheet.ciiva.com/326/littelfuse-ptc-0805l-326196.pdf?src-supplier=Digikey; ComponentLink1Description: https://datasheet.ciiva.com/326/littelfuse-ptc-0805l-326196.pdf?src-supplier=Digikey; ComponentLink2URL: https://datasheet.ciiva.com/4501/littelfuse-0805l-32472-4501285.pdf?src-supplier=Mouser; ComponentLink2Description: https://datasheet.ciiva.com/4501/littelfuse-0805l-32472-4501285.pdf?src-supplier=Mouser; ComponentLink3URL: https://datasheet.ciiva.com/28410/147852-28410764.pdf?src-supplier=Element14; ComponentLink3Description: https://datasheet.ciiva.com/28410/147852-28410764.pdf?src-supplier=Element14; ComponentLink4URL: https://datasheet.ciiva.com/8005/littelfuse-0805-8005343.pdf?src-supplier=Element14; ComponentLink4Description: https://datasheet.ciiva.com/8005/littelfuse-0805-8005343.pdf?src-supplier=Element14; ComponentLink5URL: https://datasheet.ciiva.com/1273/611626-1273580.pdf?src-supplier=Element14; ComponentLink5Description: https://datasheet.ciiva.com/1273/611626-1273580.pdf?src-supplier=Element14; ComponentLink6URL: https://datasheet.ciiva.com/15186/getdatasheetpartid-27833-15186860.pdf?src-supplier=Verical; ComponentLink6Description: https://datasheet.ciiva.com/15186/getdatasheetpartid-27833-15186860.pdf?src-supplier=Verical; ComponentLink7URL: https://datasheet.ciiva.com/16389/littelfuse-0805-16389019.pdf?src-supplier=Future+Electronics; ComponentLink7Description: https://datasheet.ciiva.com/16389/littelfuse-0805-16389019.pdf?src-supplier=Future+Electronics; ComponentLink8URL: https://datasheet.ciiva.com/326/littelfuse-ptc-0805l-326197.pdf?src-supplier=Digikey; ComponentLink8Description: https://datasheet.ciiva.com/326/littelfuse-ptc-0805l-326197.pdf?src-supplier=Digikey; ComponentLink9URL: https://datasheet.ciiva.com/326/littelfuse-ptc-0805l-326198.pdf?src-supplier=Digikey; ComponentLink9Description: https://datasheet.ciiva.com/326/littelfuse-ptc-0805l-326198.pdf?src-supplier=Digikey; LCSC Part Number: C207022
J15 = 5000: PC TEST POINT MINIATURE RED; Manufacturer: Keystone Electronics; Item Type: Connector; Plating: Silver; Body Material: Bronze,PBT; Insulation: Insulated; Outside Diameter: 2.54mm; Inside Diameter: 1.27mm; Hole Diameter: 1.6mm; Supplier: Digikey; LCSC Part Number: C5199900; Manufacturer Part Number: 5000; RoHS: Yes; Stock: 24415; Pricing: 1=0.38, 25=0.308, 100=0.3015, 250=0.28304, 500=0.2523, 1000=0.17746, 2500=0.16225, 5000=0.15211 (USD); Mounting Technology: PCB,Through Hole; Color: Red; Material: Nylon,Bronze,Silver; Contact Material: Bronze; Contact Plating: Tin,Silver; Series: THM; Packaging: Bulk; Package Quantity: 100; Length: 7.62mm; Height: 0.3inch; RoHS Compliant: Yes; Reach SVHC Compliant: No; Lead Free: Lead Free; Flammability Rating: UL94 V-0; ComponentLink1URL: https://datasheet.ciiva.com/11836/0900766b8009b7c7-11836046.pdf?src-supplier=Rs; ComponentLink1Description: https://datasheet.ciiva.com/11836/0900766b8009b7c7-11836046.pdf?src-supplier=Rs; ComponentLink2URL: https://datasheet.ciiva.com/16883/70182825-16883965.pdf?src-supplier=Allied+Electronics; ComponentLink2Description: https://datasheet.ciiva.com/16883/70182825-16883965.pdf?src-supplier=Allied+Electronics; ComponentLink3URL: https://datasheet.ciiva.com/2917/5000-5004-2917627.pdf?src-supplier=Digikey; ComponentLink3Description: https://datasheet.ciiva.com/2917/5000-5004-2917627.pdf?src-supplier=Digikey
J16 = 5001: PC TEST POINT MINIATURE BLACK; Manufacturer: Keystone Electronics; Item Type: Connector; Plating: Silver; Body Material: Bronze; Number of Ports: 1; Insulation: Insulated; Outside Diameter: 2.54mm; Hole Diameter: 1.6mm; Inside Diameter: 1.27mm; Supplier: Digikey; LCSC Part Number: C238122; Manufacturer Part Number: 5001; RoHS: Yes; Stock: 323409; Pricing: 1=0.38, 25=0.308, 100=0.3015, 250=0.28304, 500=0.2523, 1000=0.17746, 2500=0.16225, 5000=0.15211 (USD); Mounting Technology: Through Hole; Contact Material: Bronze; Contact Plating: Tin,Silver; Color: Black; Housing Color: Black; Material: Nylon,Bronze,Silver; Insulation Material: Nylon; Packaging: Bulk; Termination: Through Hole; Series: THM; Package Quantity: 100; Number of Contacts: 1; Orientation: Straight; Diameter: 2.54mm; Length: 7.62mm; Reach SVHC Compliant: No; RoHS Compliant: Yes; Lead Free: Lead Free; ComponentLink1URL: https://datasheet.ciiva.com/11836/0900766b8009b7c7-11836045.pdf?src-supplier=Rs; ComponentLink1Description: https://datasheet.ciiva.com/11836/0900766b8009b7c7-11836045.pdf?src-supplier=Rs; ComponentLink2URL: https://datasheet.ciiva.com/27052/1581986-27052611.pdf?src-supplier=Jameco; ComponentLink2Description: https://datasheet.ciiva.com/27052/1581986-27052611.pdf?src-supplier=Jameco; ComponentLink3URL: https://datasheet.ciiva.com/22631/1703983-22631100.pdf?src-supplier=Element14; ComponentLink3Description: https://datasheet.ciiva.com/22631/1703983-22631100.pdf?src-supplier=Element14; ComponentLink4URL: https://datasheet.ciiva.com/16318/m60-2p60-16318423.pdf?src-supplier=Future+Electronics; ComponentLink4Description: https://datasheet.ciiva.com/16318/m60-2p60-16318423.pdf?src-supplier=Future+Electronics
L1 = SRN4018-4R7M: FIXED IND 4.7UH 1.9A 84 MOHM SMD; Manufacturer: Bourns; Core Material: Ferrite; Material: Steel; Saturation Current: 2A; Tolerance: 20%; Shielding: Shielded; DC Resistance (DCR): 84mR; Self Resonant Frequency: 35MHz; Test Frequency: 100kHz; Q Factor: 9NUMBER; Supplier: Rs; LCSC Part Number: C780206; Manufacturer Part Number: SRN4018-4R7M; RoHS: Yes; Category: Fixed Inductors; Stock: 13110; Mounting Technology: Surface Mount; Case/Package: Nonstandard; Pins: 2; Min Operating Temperature: -25°C; Max Operating Temperature: 120°C; Packaging: Cut Tape; Package Quantity: 3000; Current Rating: 1.9A; Value: 4.7uH; Inductance Tolerance: 20%; Max DC Current: 1.9A; Termination: SMD/SMT; RMS Current (Irms): 1.9A; Series: SRN4018; Sample Rate (Hz): 100kHz; ESR: 84mR; Length: 4mm; Width: 4mm; Height: 1.8mm; Height - Seated (Max): 0.071inch; Depth: 4.2mm; Radiation Hardening: No; Reach SVHC Compliant: No; RoHS Compliant: Yes; ComponentLink1URL: https://datasheet.ciiva.com/6700/srn4018-6700960.pdf?src-supplier=Digikey; ComponentLink1Description: https://datasheet.ciiva.com/6700/srn4018-6700960.pdf?src-supplier=Digikey; Supplier Part Number: C135270; Pricing: 10=0.0497, 100=0.0399, 300=0.035, 2000=0.0313, 4000=0.0283, 10000=0.0269 (USD)
LED1-LED4 = NCD0603R3: RED LED 0603 Light Emitting Diodes; Manufacturer: Foshan NationStar Optoelectronics; Manufacturer Part Number: NCD0603R3; Package: 0603; Item Type: LED; LCSC Part Number: C3151730; ComponentLink1Description: LCSC; ComponentLink1URL: https://www.lcsc.com/product-detail/Light-Emitting-Diodes-LED_Foshan-NationStar-Optoelectronics-NCD0603R3_C3151730.html
R1 = RC0402FR-0710KL: RES 10K OHM 1% 1/16W 0402; Manufacturer: Yageo; Resistance: 10kR; Voltage Rating (DC): 50V; Temperature Coefficient: 100ppm/°C; Power Rating: 62.5mW; Max Power Dissipation: 63mW; Item Type: Resistor; Supplier 1: Mouser; Manufacturer Part Number: RC0402FR-0710KL; RoHS: Yes; Category: Chip SMD Resistors; Stock 1: 18648329; Pricing 1: 1=0.10000, 10=0.01400, 50=0.01400, 100=0.00500, 1000=0.00300, 10000=0.00200 (USD); Case/Package: 0402; Number of Pins: 2; Case Code (Imperial): 0402; Case Code (Metric): 1005; Min Operating Temperature: -55°C; Max Operating Temperature: 155°C; Resistor Type: Thick Film; Tolerance: 1%; Packaging: Tape and Reel; Voltage Rating: 50V; Termination: SMD/SMT; Working Voltage: 50V; Number of Terminations: 2; Features: Moisture Resistant; Series: RC; Resistance Tolerance: 1%; Construction: Rectangular; Length: 1mm; Width: 0.5mm; Height: 0.32mm; Depth: 0.5mm; Lead Pitch: 0.2mm; REACH SVHC: No SVHC; Lead Free: Lead Free; RoHS Compliant: Yes; Military Standard: Not; ComponentLink1URL: https://datasheet.ciiva.com/7660/38568-7660787.pdf?src-supplier=Element14; ComponentLink1Description: https://datasheet.ciiva.com/7660/38568-7660787.pdf?src-supplier=Element14; ComponentLink2URL: https://datasheet.ciiva.com/7849/1686128-7849814.pdf?src-supplier=Element14; ComponentLink2Description: https://datasheet.ciiva.com/7849/1686128-7849814.pdf?src-supplier=Element14; ComponentLink3URL: https://datasheet.ciiva.com/7983/1018594-7983486.pdf?src-supplier=Element14; ComponentLink3Description: https://datasheet.ciiva.com/7983/1018594-7983486.pdf?src-supplier=Element14; ComponentLink4URL: https://datasheet.ciiva.com/22747/1018594-22747512.pdf?src-supplier=Element14; ComponentLink4Description: https://datasheet.ciiva.com/22747/1018594-22747512.pdf?src-supplier=Element14; ComponentLink5URL: https://datasheet.ciiva.com/12667/pyu-rc0402-51-rohs-l-6-r-12667067.pdf?src-supplier=Mouser; ComponentLink5Description: https://datasheet.ciiva.com/12667/pyu-rc0402-51-rohs-l-6-r-12667067.pdf?src-supplier=Mouser; ComponentLink6URL: https://datasheet.ciiva.com/7849/1784430-7849813.pdf?src-supplier=Element14; ComponentLink6Description: https://datasheet.ciiva.com/7849/1784430-7849813.pdf?src-supplier=Element14; ComponentLink7URL: https://datasheet.ciiva.com/7849/1784430-7849815.pdf?src-supplier=Element14; ComponentLink7Description: https://datasheet.ciiva.com/7849/1784430-7849815.pdf?src-supplier=Element14; Supplier Part Number 1: 603-RC0402FR-0710KL; LCSC Part Number: C60490
R2 = RC0402FR-073K9L: RES 3.9K OHM 1% 1/16W 0402; Manufacturer: Yageo; Temperature Coefficient: 100ppm/°C; Power Rating: 62.5mW; Value: 3.9kR; Voltage Rating: 50V; Max Power Dissipation: 63mW; Item Type: Resistor; Supplier: Future Electronics; Supplier Part Number: 9808155; Manufacturer Part Number: RC0402FR-073K9L; RoHS: Yes; Category: Chip SMD Resistors; Stock: 6910000; Pricing: 10000=0.0011, 100000=0.0011, 300000=0.001, 750000=0.001, 2000000=0.0009 (USD); Case/Package: 0402; Case Code (Imperial): 0402; Case Code (Metric): 1005; Min Operating Temperature: -55°C; Max Operating Temperature: 155°C; Tolerance: 1%; Packaging: Tape and Reel; Resistor Type: Thick Film; Series: RC; Termination: SMD/SMT; Number of Terminations: 2; Features: Moisture Resistant; Resistance Tolerance: 1%; Construction: Rectangular; Voltage Rating (AC): 50V; Length: 1mm; Depth: 0.5mm; Lead Free: Lead Free; RoHS Compliant: Yes; Reach SVHC Compliant: Unknown; Military Standard: Not; ComponentLink1URL: https://datasheet.ciiva.com/12666/pyu-rc0402-51-rohs-l-6-r-12666997.pdf?src-supplier=Mouser; ComponentLink1Description: https://datasheet.ciiva.com/12666/pyu-rc0402-51-rohs-l-6-r-12666997.pdf?src-supplier=Mouser; ComponentLink2URL: https://datasheet.ciiva.com/7849/1018594-7849989.pdf?src-supplier=Element14; ComponentLink2Description: https://datasheet.ciiva.com/7849/1018594-7849989.pdf?src-supplier=Element14; ComponentLink3URL: https://datasheet.ciiva.com/7849/1018594-7849990.pdf?src-supplier=Element14; ComponentLink3Description: https://datasheet.ciiva.com/7849/1018594-7849990.pdf?src-supplier=Element14; ComponentLink4URL: https://datasheet.ciiva.com/15189/getdatasheetpartid-469246-15189453.pdf?src-supplier=Verical; ComponentLink4Description: https://datasheet.ciiva.com/15189/getdatasheetpartid-469246-15189453.pdf?src-supplier=Verical; LCSC Part Number: C131467
R3 = RT0402BRC076K8L: RES SMD 6.8K OHM 0.1% 1/16W 0402; Manufacturer: Yageo; Item Type: Resistors; Value: 6.8kR; Max Power Dissipation: 63mW; Temperature Coefficient: 15ppm/°C; Supplier: Digikey; LCSC Part Number: C852943; Manufacturer Part Number: RT0402BRC076K8L; RoHS: Yes; Stock: 20494; Pricing: 1=0.51, 10=0.36, 50=0.279, 100=0.2487, 500=0.18748, 1000=0.16452, 5000=0.14066 (USD); Case/Package: 0402; Min Operating Temperature: -55°C; Max Operating Temperature: 155°C; Packaging: Tape and Reel; Number of Terminations: 2; Tolerance: 0.1%; Features: Moisture Resistant; Series: RT; Length: 0.039inch; Width: 0.02inch; Height: 0.014inch; RoHS Compliant: Yes
R4 R6 = RC0402FR-07499RL: RES 499 OHM 1% 1/16W 0402; Manufacturer: Yageo; Power Rating: 62.5mW; Voltage Rating: 50V; Max Power Dissipation: 63mW; Temperature Coefficient: 100ppm/°C; Supplier 1: Mouser; Manufacturer Part Number: RC0402FR-07499RL; RoHS: Yes; Category: Chip SMD Resistors; Stock 1: 936879; Pricing 1: 1=0.10000, 10=0.01200, 50=0.01200, 100=0.00500, 1000=0.00300, 10000=0.00100 (USD); Case/Package: 0402; Case Code (Metric): 1005; Case Code (Imperial): 0402; Size Code: 0402; Min Operating Temperature: -55°C; Max Operating Temperature: 155°C; Resistance: 499R; Tolerance: 1%; Package Quantity: 1; Packaging: Tape and Reel; Resistor Type: Thick Film; Number of Terminations: 2; Termination: SMD/SMT; Voltage Rating (DC): 50V; Features: Moisture Resistant; Series: RC; Resistance Tolerance: 1%; Construction: Rectangular; Length: 1mm; Width: 0.02inch; Height: 0.016inch; Depth: 0.5mm; RoHS Compliant: Yes; REACH SVHC: No SVHC; Military Standard: Not; Lead Free: Lead Free; ComponentLink1URL: https://datasheet.ciiva.com/2453/pyu-r-int-thick-7-2453539.pdf?src-supplier=Digi-Key; ComponentLink1Description: https://datasheet.ciiva.com/2453/pyu-r-int-thick-7-2453539.pdf?src-supplier=Digi-Key; ComponentLink2URL: https://datasheet.ciiva.com/2453/pyu-r-int-thick-7-2453540.pdf?src-supplier=Digi-Key; ComponentLink2Description: https://datasheet.ciiva.com/2453/pyu-r-int-thick-7-2453540.pdf?src-supplier=Digi-Key; ComponentLink3URL: https://datasheet.ciiva.com/2453/pyu-r-int-thick-7-2453538.pdf?src-supplier=Digi-Key; ComponentLink3Description: https://datasheet.ciiva.com/2453/pyu-r-int-thick-7-2453538.pdf?src-supplier=Digi-Key; Supplier Part Number 1: 603-RC0402FR-07499RL; LCSC Part Number: C137970
R5 = RC0402FR-07240RL: RES 240 OHM 1% 1/16W 0402; Manufacturer: Yageo; Item Type: Resistors; Power Rating: 63mW; Temperature Coefficient: 100ppm/°C; Voltage Rating (DC): 50V; Supplier 1: Mouser; Manufacturer Part Number: RC0402FR-07240RL; RoHS: Yes; Stock 1: 1903202; Pricing 1: 1=0.10000, 10=0.01200, 50=0.01200, 100=0.00500, 1000=0.00300, 10000=0.00100 (USD); Case/Package: 0402; Case Code (Metric): 1005; Case Code (Imperial): 0402; Size Code: 0402; Min Operating Temperature: -55°C; Max Operating Temperature: 155°C; Resistance: 240R; Tolerance: 1%; Packaging: Tape and Reel; Resistor Type: Thick Film; Voltage Rating: 50V; Package Quantity: 1; Number of Terminations: 2; Termination: SMD/SMT; Max Power Dissipation: 63mW; Features: Moisture Resistant; Series: RC; Construction: Rectangular; Resistance Tolerance: 1%; Length: 1mm; Width: 0.02inch; Height: 0.016inch; Depth: 0.5mm; REACH SVHC: Unknown; Lead Free: Lead Free; RoHS Compliant: Yes; Military Standard: Not; ComponentLink1URL: https://datasheet.ciiva.com/7849/1018594-7849915.pdf?src-supplier=Element14; ComponentLink1Description: https://datasheet.ciiva.com/7849/1018594-7849915.pdf?src-supplier=Element14; ComponentLink2URL: https://datasheet.ciiva.com/7849/1018594-7849916.pdf?src-supplier=Element14; ComponentLink2Description: https://datasheet.ciiva.com/7849/1018594-7849916.pdf?src-supplier=Element14; ComponentLink3URL: https://datasheet.ciiva.com/2519/pyu-r-int-thick-7-2519157.pdf?src-supplier=Digi-Key; ComponentLink3Description: https://datasheet.ciiva.com/2519/pyu-r-int-thick-7-2519157.pdf?src-supplier=Digi-Key; ComponentLink4URL: https://datasheet.ciiva.com/2519/pyu-r-int-thick-7-2519158.pdf?src-supplier=Digi-Key; ComponentLink4Description: https://datasheet.ciiva.com/2519/pyu-r-int-thick-7-2519158.pdf?src-supplier=Digi-Key; ComponentLink5URL: https://datasheet.ciiva.com/2519/pyu-r-int-thick-7-2519156.pdf?src-supplier=Digi-Key; ComponentLink5Description: https://datasheet.ciiva.com/2519/pyu-r-int-thick-7-2519156.pdf?src-supplier=Digi-Key; ComponentLink6URL: https://datasheet.ciiva.com/12669/pyu-rc0402-51-rohs-l-6-r-12669689.pdf?src-supplier=Mouser; ComponentLink6Description: https://datasheet.ciiva.com/12669/pyu-rc0402-51-rohs-l-6-r-12669689.pdf?src-supplier=Mouser; ComponentLink7URL: https://datasheet.ciiva.com/17419/pyu-rc0402-51-rohs-l-6-r-17419482.pdf?src-supplier=Future+Electronics; ComponentLink7Description: https://datasheet.ciiva.com/17419/pyu-rc0402-51-rohs-l-6-r-17419482.pdf?src-supplier=Future+Electronics; Supplier Part Number 1: 603-RC0402FR-07240RL; LCSC Part Number: C114755
TP1 TP2 = TEST POINT: Test Point ON; Item Type: TEST POINT
U1 = VRB1205S-6WR3: SIP Isolated Power Modules ROHS; Manufacturer: YLPTEC; Manufacturer Part Number: VRB1205S-6WR3; Package: SIP; LCSC Part Number: C5369846; Item Type: Power Module; ComponentLink1Description: LCSC; ComponentLink1URL: https://www.lcsc.com/product-detail/Isolated-Power-Modules_YLPTEC-VRB1205S-6WR3_C5369846.html
U2 = AP63205WU-7: IC REG BUCK 5V 2A TSOT26; Manufacturer: Diodes; Supplier 1: Digi-Key; Manufacturer Part Number: AP63205WU-7; RoHS: Yes; Category: Voltage Regulators - Switching; Stock 1: 88525; Pricing 1: 1=0.88, 10=0.776, 25=0.7292, 100=0.5952, 250=0.55284, 500=0.4705, 1000=0.3764 (USD); Supplier Part Number 1: AP63205WU-7DICT-ND; LCSC Part Number: C2071056; Item Type: IC
U3 = ST1L05APU33R: IC REG LINEAR 3.3V 1.3A 6DFN; Manufacturer: STMicroelectronics; Supplier: Digikey; LCSC Part Number: C283488; Manufacturer Part Number: ST1L05APU33R; RoHS: Yes; Item Type: IC; Stock: 7599; Pricing: 1=1.06, 10=0.766, 25=0.692, 100=0.6103, 250=0.57136, 500=0.5479, 1000=0.5286 (USD); ComponentLink1URL: https://datasheet.ciiva.com/2053/cd00186925-2053848.pdf?src-supplier=Digikey; ComponentLink1Description: https://datasheet.ciiva.com/2053/cd00186925-2053848.pdf?src-supplier=Digikey; ComponentLink2URL: https://datasheet.ciiva.com/2053/cd00186925-2053849.pdf?src-supplier=Digikey; ComponentLink2Description: https://datasheet.ciiva.com/2053/cd00186925-2053849.pdf?src-supplier=Digikey; ComponentLink3URL: https://datasheet.ciiva.com/2053/cd00186925-2053850.pdf?src-supplier=Digikey; ComponentLink3Description: https://datasheet.ciiva.com/2053/cd00186925-2053850.pdf?src-supplier=Digikey; ComponentLink4URL: https://datasheet.ciiva.com/16489/cd00186925-16489850.pdf?src-supplier=Future+Electronics; ComponentLink4Description: https://datasheet.ciiva.com/16489/cd00186925-16489850.pdf?src-supplier=Future+Electronics